# Altium schematic sheet 3.uC Peripheral.SchDoc: TopLevel Schematic
size A3; Date: 2019/03/06; Author: ZhangPan; Revision: 2.0; SheetNumber: 3; SheetTotal: 4; Size: A4; Contact: 0731-88731029; ProjectName: EVM
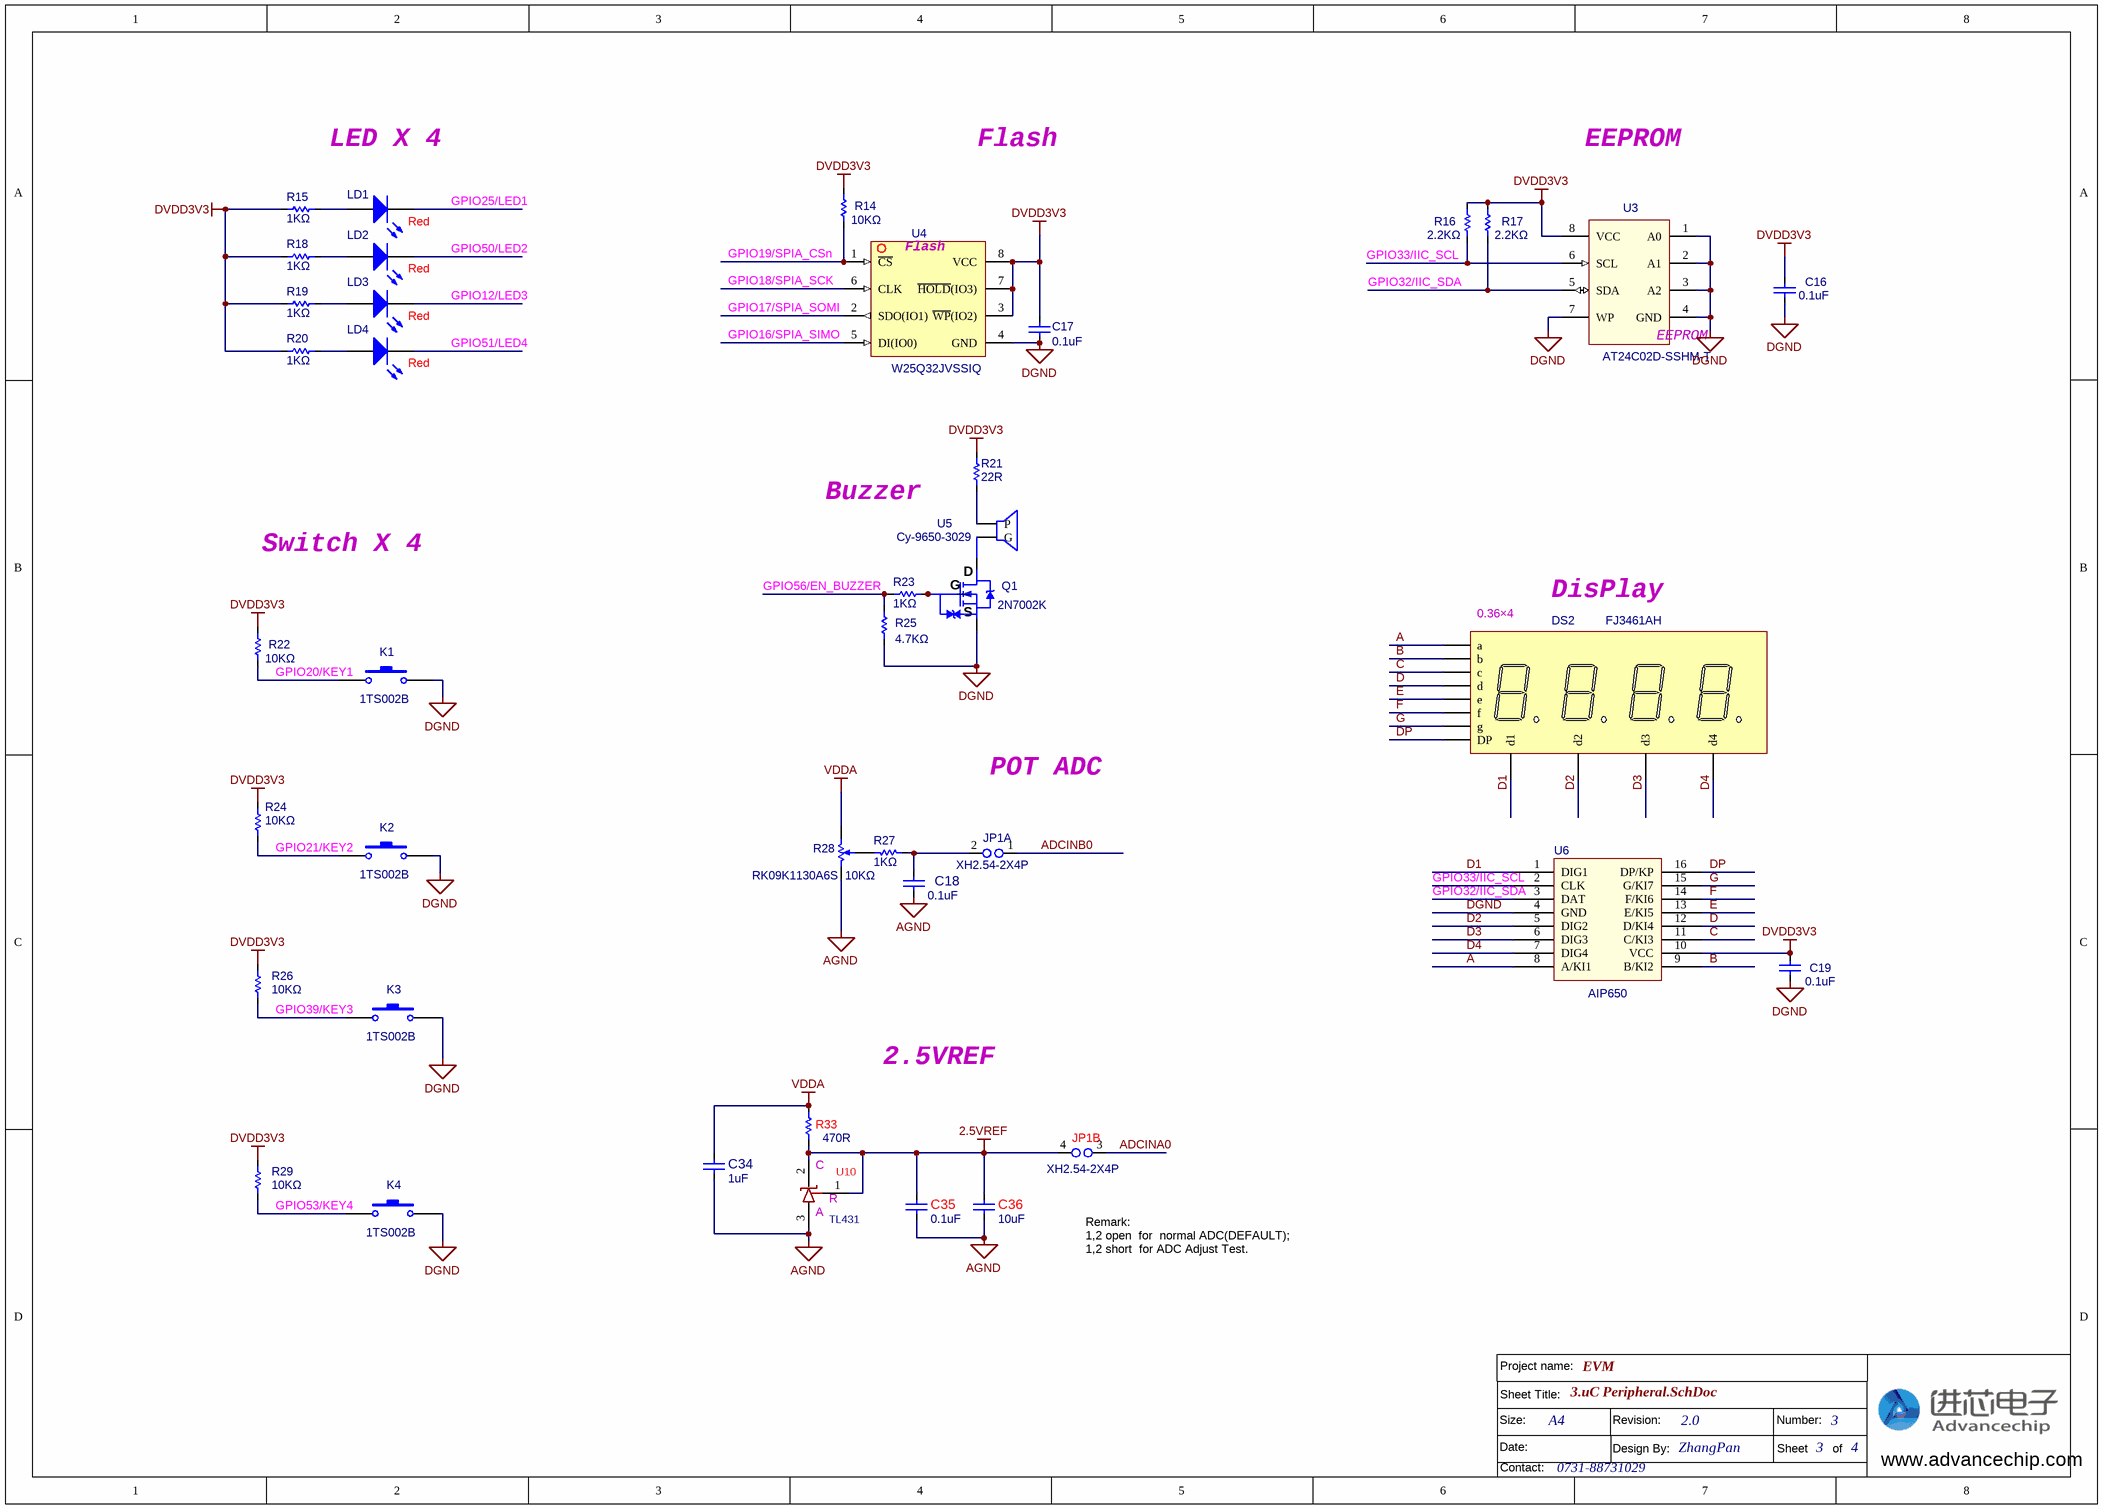
[diagram p0: 3.uC Peripheral.SchDoc]

## Parts
C16  value 0.1uF  [C0603]  (hidden comment: 0.1uF/50V)
C17  value 0.1uF  [C0603]  (hidden comment: 0.1uF/50V)
C18  value 0.1uF  [C0603]  (hidden comment: 0.1uF/50V)
C19  value 0.1uF  [C0603]  (hidden comment: 0.1uF/50V)
C34  value 1uF  [C0603]  (hidden comment: 1uF/25V)
C35  value 0.1uF  [C0603]  (hidden comment: 0.1uF/50V)
C36  value 10uF  [C0805]  (hidden comment: 10uF/10V)
DS2  FJ3461AH  value 0.36×4  [0.36X4]
JP1  XH2.54-2X4P  [SIP4X2A]  (parts A,B of 4)
K1  value 1TS002B  [SW-3X6]  (hidden comment: 1TS002B-2400-5001-CT)
K2  value 1TS002B  [SW-3X6]  (hidden comment: 1TS002B-2400-5001-CT)
K3  value 1TS002B  [SW-3X6]  (hidden comment: 1TS002B-2400-5001-CT)
K4  value 1TS002B  [SW-3X6]  (hidden comment: 1TS002B-2400-5001-CT)
LD1  Red  [SMD_LED0805_LED]
LD2  Red  [SMD_LED0805_LED]
LD3  Red  [SMD_LED0805_LED]
LD4  Red  [SMD_LED0805_LED]
Q1  2N7002K  [MOS-SOT23]
R14  10KΩ  [R0603]
R15  1KΩ  [R0603]
R16  2.2KΩ  [R0603]
R17  2.2KΩ  [R0603]
R18  1KΩ  [R0603]
R19  1KΩ  [R0603]
R20  1KΩ  [R0603]
R21  22R  [1206RX]
R22  10KΩ  [R0603]
R23  1KΩ  [R0603]
R24  10KΩ  [R0603]
R25  4.7KΩ  [R0603]
R26  10KΩ  [R0603]
R27  1KΩ  [R0603]
R28  RK09K1130A6S  10KΩ  [RK09K1130]
R29  10KΩ  [R0603]
R33  470R  [R0603]
U3  AT24C02D-SSHM-T  [SO-8]
U4  W25Q32JVSSIQ  [SOIC-8_208mil]
U5  Cy-9650-3029  [SUN-0905-3V]
U6  AIP650  [SOIC-16_150mil]
U10  TL431  [SOT-23]

## Nets
2.5VREF: C35.1 C36.1 JP1.4 R33.2 U10.1(R) U10.2(C)
AGND: C18.2 C34.2 C35.2 C36.2 R28.1 U10.3(A)
DGND: C16.2 C17.2 C19.2 K1.2 K2.2 K3.2 K4.2 Q1.S R25.2 U3.1(A0) U3.2(A1) U3.3(A2) U3.4(GND) U3.7(WP) U4.4(GND) U6.4(GND)
DVDD3V3: C16.1 C17.1 C19.1 R14.1 R15.2 R16.2 R17.2 R18.2 R19.2 R20.2 R21.1 R22.1 R24.1 R26.1 R29.1 U3.8(VCC) U4.3(~{WP}(IO2)) U4.7(~{HOLD}(IO3)) U4.8(VCC) U6.10(VCC)
VDDA: C34.1 R28.3 R33.1
A: DS2.a U6.8(A/KI1)
ADCINA0: JP1.3
ADCINB0: JP1.1
B: DS2.b U6.9(B/KI2)
C: DS2.c U6.11(C/KI3)
D: DS2.d U6.12(D/KI4)
D1: DS2.com1(d1) U6.1(DIG1)
D2: DS2.com2(d2) U6.5(DIG2)
D3: DS2.com3(d3) U6.6(DIG3)
D4: DS2.com4(d4) U6.7(DIG4)
DP: DS2.dp(DP) U6.16(DP/KP)
E: DS2.e U6.13(E/KI5)
F: DS2.f U6.14(F/KI6)
G: DS2.g U6.15(G/KI7)
GPIO12/LED3: LD3.2(K)
GPIO16/SPIA_SIMO: U4.5(DI(IO0))
GPIO17/SPIA_SOMI: U4.2(SDO(IO1))
GPIO18/SPIA_SCK: U4.6(CLK)
GPIO19/SPIA_CSn: R14.2 U4.1(~{CS})
GPIO20/KEY1: K1.1 R22.2
GPIO21/KEY2: K2.1 R24.2
GPIO25/LED1: LD1.2(K)
GPIO32/IIC_SDA: R17.1 U3.5(SDA) U6.3(DAT)
GPIO33/IIC_SCL: R16.1 U3.6(SCL) U6.2(CLK)
GPIO39/KEY3: K3.1 R26.2
GPIO50/LED2: LD2.2(K)
GPIO51/LED4: LD4.2(K)
GPIO53/KEY4: K4.1 R29.2
GPIO56/EN_BUZZER: R23.2 R25.1
NetC18_1: C18.1 JP1.2 R27.2
NetLD1_1: LD1.1(A) R15.1
NetLD2_1: LD2.1(A) R18.1
NetLD3_1: LD3.1(A) R19.1
NetLD4_1: LD4.1(A) R20.1
NetQ1_D: Q1.D U5.2(G)
NetQ1_G: Q1.G R23.1
NetR21_2: R21.2 U5.1(P)
NetR27_1: R27.1 R28.2

## Notes on the sheet
- LED X 4
- Flash
- EEPROM
- Buzzer
- Switch X 4
- (near DS2) DisPlay
- POT ADC
- 2.5VREF
- Remark:
  1,2 open  for  normal ADC(DEFAULT);
  1,2 short  for ADC Adjust Test.
- Sheet Title:
- Project name:
- Size:
- Date:
- Contact:
- Revision:
- Design By:
- Number:
- Sheet       of
- www.advancechip.com
- (in symbol AT24C02C) EEPROM
- (in symbol W25Q128) Flash

## Library data of the parts
C16-C19 C34-C36 = Cap: 贴片电容; Published: 8-Jun-2000; LatestRevisionDate: 17-Jul-2002; LatestRevisionNote: Re-released for DXP Platform.; Publisher: Altium Limited
DS2 = Dpy Amber-4K: 4位0.36英寸红色共阴七段数码管; 焊接类型: 直插; ComponentLink1URL: *; ComponentLink2Description: *; ComponentLink2URL: *; ComponentLink3Description: *; ComponentLink3URL: *; Pin: 12
JP1 = Jumper2: 2.54双排插针; Published: 24-Mar-1999; LatestRevisionDate: 17-Jul-2002; LatestRevisionNote: Re-released for DXP Platform.; Publisher: Altium Limited
K1-K4 = SW-PB: 鸿源精密轻触开关3X6; Published: 24-Mar-1999; LatestRevisionDate: 17-Jul-2002; LatestRevisionNote: Re-released for DXP Platform.; Publisher: Altium Limited
LD1-LD4 = LED0: 发光二极管; Published: 8-Jun-2000; LatestRevisionDate: 08-Jul-2005; LatestRevisionNote: Mech Layer 1 removed.; PackageReference: LED-0; Publisher: Altium Limited; PackageDescription: LED; 2 Leads
Q1 = 2SK3019: N-MOSFET 60V300mA低开启电压; Published: 8-Jun-2000; LatestRevisionDate: 17-Jul-2002; LatestRevisionNote: Re-released for DXP Platform.; Publisher: Altium Limited
R14-R27 R29 = Res: 贴片电阻; Value: 1K; Published: 8-Jun-2000; LatestRevisionDate: 17-Jul-2002; LatestRevisionNote: Re-released for DXP Platform.; Publisher: Altium Limited
R28 = RPot SM: 立式可调电位器; Published: 17-Dec-2003; DatasheetDocument: Oct-2003; Publisher: Altium Limited
R33 = Res: 贴片电阻; Temperature Coefficient: 100ppm/ ℃; Tolerance: 1%; Voltage Rating: 75V; Power Rating: 1/10W; Operating Temperature Range: -55~+125℃; Category: 贴片电阻; PackageReference: 0603; Composition: Thick Film; MountType: Surface Mount (SMD - SMT); RoHS: Y; Supplier 2: 1; Storage Room  Code: 000000
U3 = AT24C02C: EEPROM存储器
U4 = W25Q128: 华邦FLASH存储器
U5 = BEEP: 超音V有源蜂鸣器 电磁式 脚距5,外径9.5mm
U6 = AIP650E: 无锡中微LED驱动芯片
U10 = AZ431AN-ATRE1: 2.5V基准芯片 0.5%, 1R,2C,3A; spiceSymbolName: https://item.szlcsc.com/192500.html